# Altium schematic sheet Memory.SchDoc
size A4; SheetNumber: 8; SheetTotal: 9
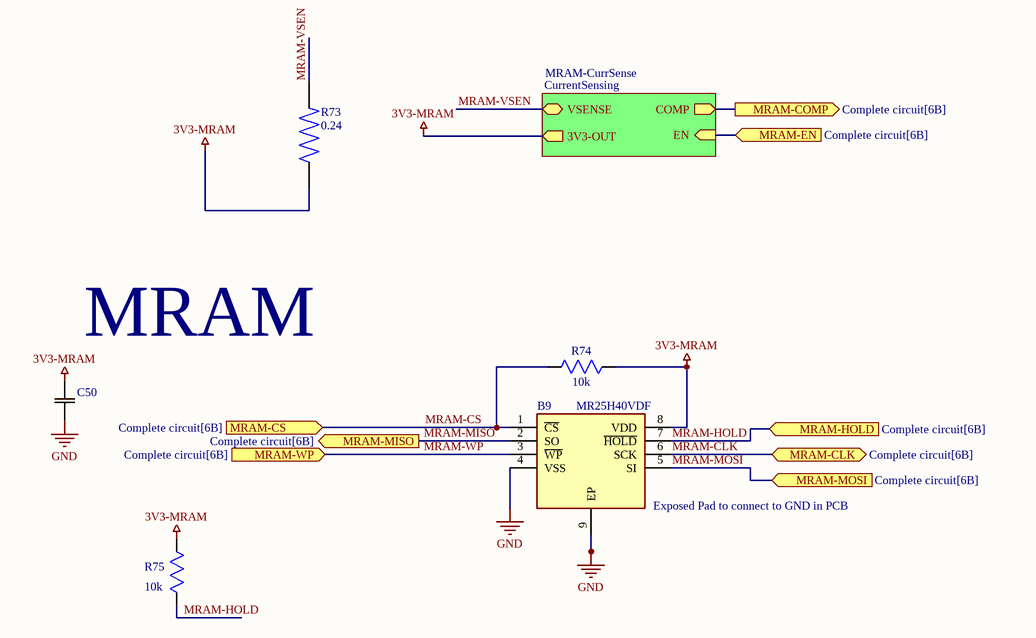
[diagram p0: Memory.SchDoc]

## Parts
B9  MR25H40VDF  [SON127P600X500X90-9N-D]
C50  C1206C104J4GACAUTO  [CAPC340180_180N_KEM]  (value not drawn)
R73  value 0.24  [RES_ERJ3BQFR24V]  (hidden comment: ERJ3BQFR24V)
R74  value 10k  [RES_ERA3ARB103V]  (hidden comment: ERA3ARB103V)
R75  value 10k  [RES_ERA3ARB103V]  (hidden comment: ERA3ARB103V)

## Sub-sheets
MRAM-CurrSense = CurrentSensing: VSENSE (bidir), 3V3-OUT (out), COMP (out), EN (in)

## Ports
MRAM-CLK (bidir, see Complete circuit[6B]), MRAM-COMP (out, see Complete circuit[6B]), MRAM-CS (in, see Complete circuit[6B]), MRAM-EN (in, see Complete circuit[6B]), MRAM-HOLD (in, see Complete circuit[6B]), MRAM-MISO (out, see Complete circuit[6B]), MRAM-MOSI (in, see Complete circuit[6B]), MRAM-WP (in, see Complete circuit[6B])

## Nets
3V3-MRAM: B9.8(VDD) C50.2 R73.1 R74.2 R75.1 ; sheet MRAM-CurrSense/3V3-OUT
GND: B9.4(VSS) B9.9(EP) C50.1
MRAM-CLK: B9.6(SCK) ; port MRAM-CLK
MRAM-COMP: port MRAM-COMP, sheet MRAM-CurrSense/COMP
MRAM-CS: B9.1(~{CS}) R74.1 ; port MRAM-CS
MRAM-EN: port MRAM-EN, sheet MRAM-CurrSense/EN
MRAM-HOLD: B9.7(~{HOLD}) R75.2 ; port MRAM-HOLD
MRAM-MISO: B9.2(SO) ; port MRAM-MISO
MRAM-MOSI: B9.5(SI) ; port MRAM-MOSI
MRAM-VSEN: R73.2 ; sheet MRAM-CurrSense/VSENSE
MRAM-WP: B9.3(~{WP}) ; port MRAM-WP

## Notes on the sheet
- (near C50) MRAM
- (near B9) Exposed Pad to connect to GND in PCB

## Library data of the parts
B9 = CMP-071-000002-1: MRAM 4Mb 3.3V 512Kx8 SPI MRAM; Manufacturer_Name: Everspin Technologies; Geometry.Height: 0.9mm; __ORIG_LIFECYCLESTATEGUID__: 706004B5-C76E-482E-903B-BA0E4FAE086A; Design Item ID: MR25H40VDF; Manufacturer_Part_Number: MR25H40VDF; Source: MR25H40VDF.SchLib; Datasheet Link: https://www.everspin.com/getdatasheet/MR25H40; Mouser Part Number: 936-MR25H40VDF; Mouser Price/Stock: https://www.mouser.co.uk/ProductDetail/Everspin-Technologies/MR25H40VDF?qs=wUXugUrL1qy8G9iN6Ia%2F%2FQ%3D%3D
C50 = CMP-001-00131-4: SMD Auto C0G, Ceramic, 0.1 uF, 5%, 16 VDC, C0G, SMD, MLCC, Ultra-Stable, Low Loss, Automotive Grade, 1206; Manufacturer_Name: Kemet; Copyright: Copyright (C) 2025 Ultra Librarian. All rights reserved.; Manufacturer_Part_Number: C1206C104J4GACAUTO; Source: C1206C104J4GACAUTO.SchLib; Design Item ID: C1206C104J4GACAUTO
R73 = CMP-009-00269-1: Res Thick Film 0603 0.24 Ohm 1% 0.25W(1/4W) 300ppm/C Pad SMD Automotive T/R; MP: ERJ-3BQFR24V; MF: Panasonic; Case/Package: 1608-2 Panasonic; Source: ERJ3BQFR24V.SchLib; Check_prices: https://www.snapeda.com/parts/ERJ-3BQFR24V/Panasonic/view-part/?ref=eda; Component Type: Standard; Pins: 2; SnapEDA_Link: https://www.snapeda.com/parts/ERJ-3BQFR24V/Panasonic/view-part/?ref=snap; Design Item ID: ERJ3BQFR24V
R74 R75 = CMP-009-00245-3: Thin Film Resistors - SMD 0603 10Kohm 0.1% 10ppm AEC-Q200; Design Item ID: ERA3ARB103V; Case/Package: None; Pins: 2; Source: ERA3ARB103V.SchLib; Component Type: Standard; MP: ERA3ARB103V; Availability: Unavailable; Price: None